# Altium project Camera-Controller-Board.PrjPcb (part 10 of 18)

## Sheet RK3588-GPIO.SchDoc
size 420 x 297 mm; SheetNumber: 13; SheetTotal: 22
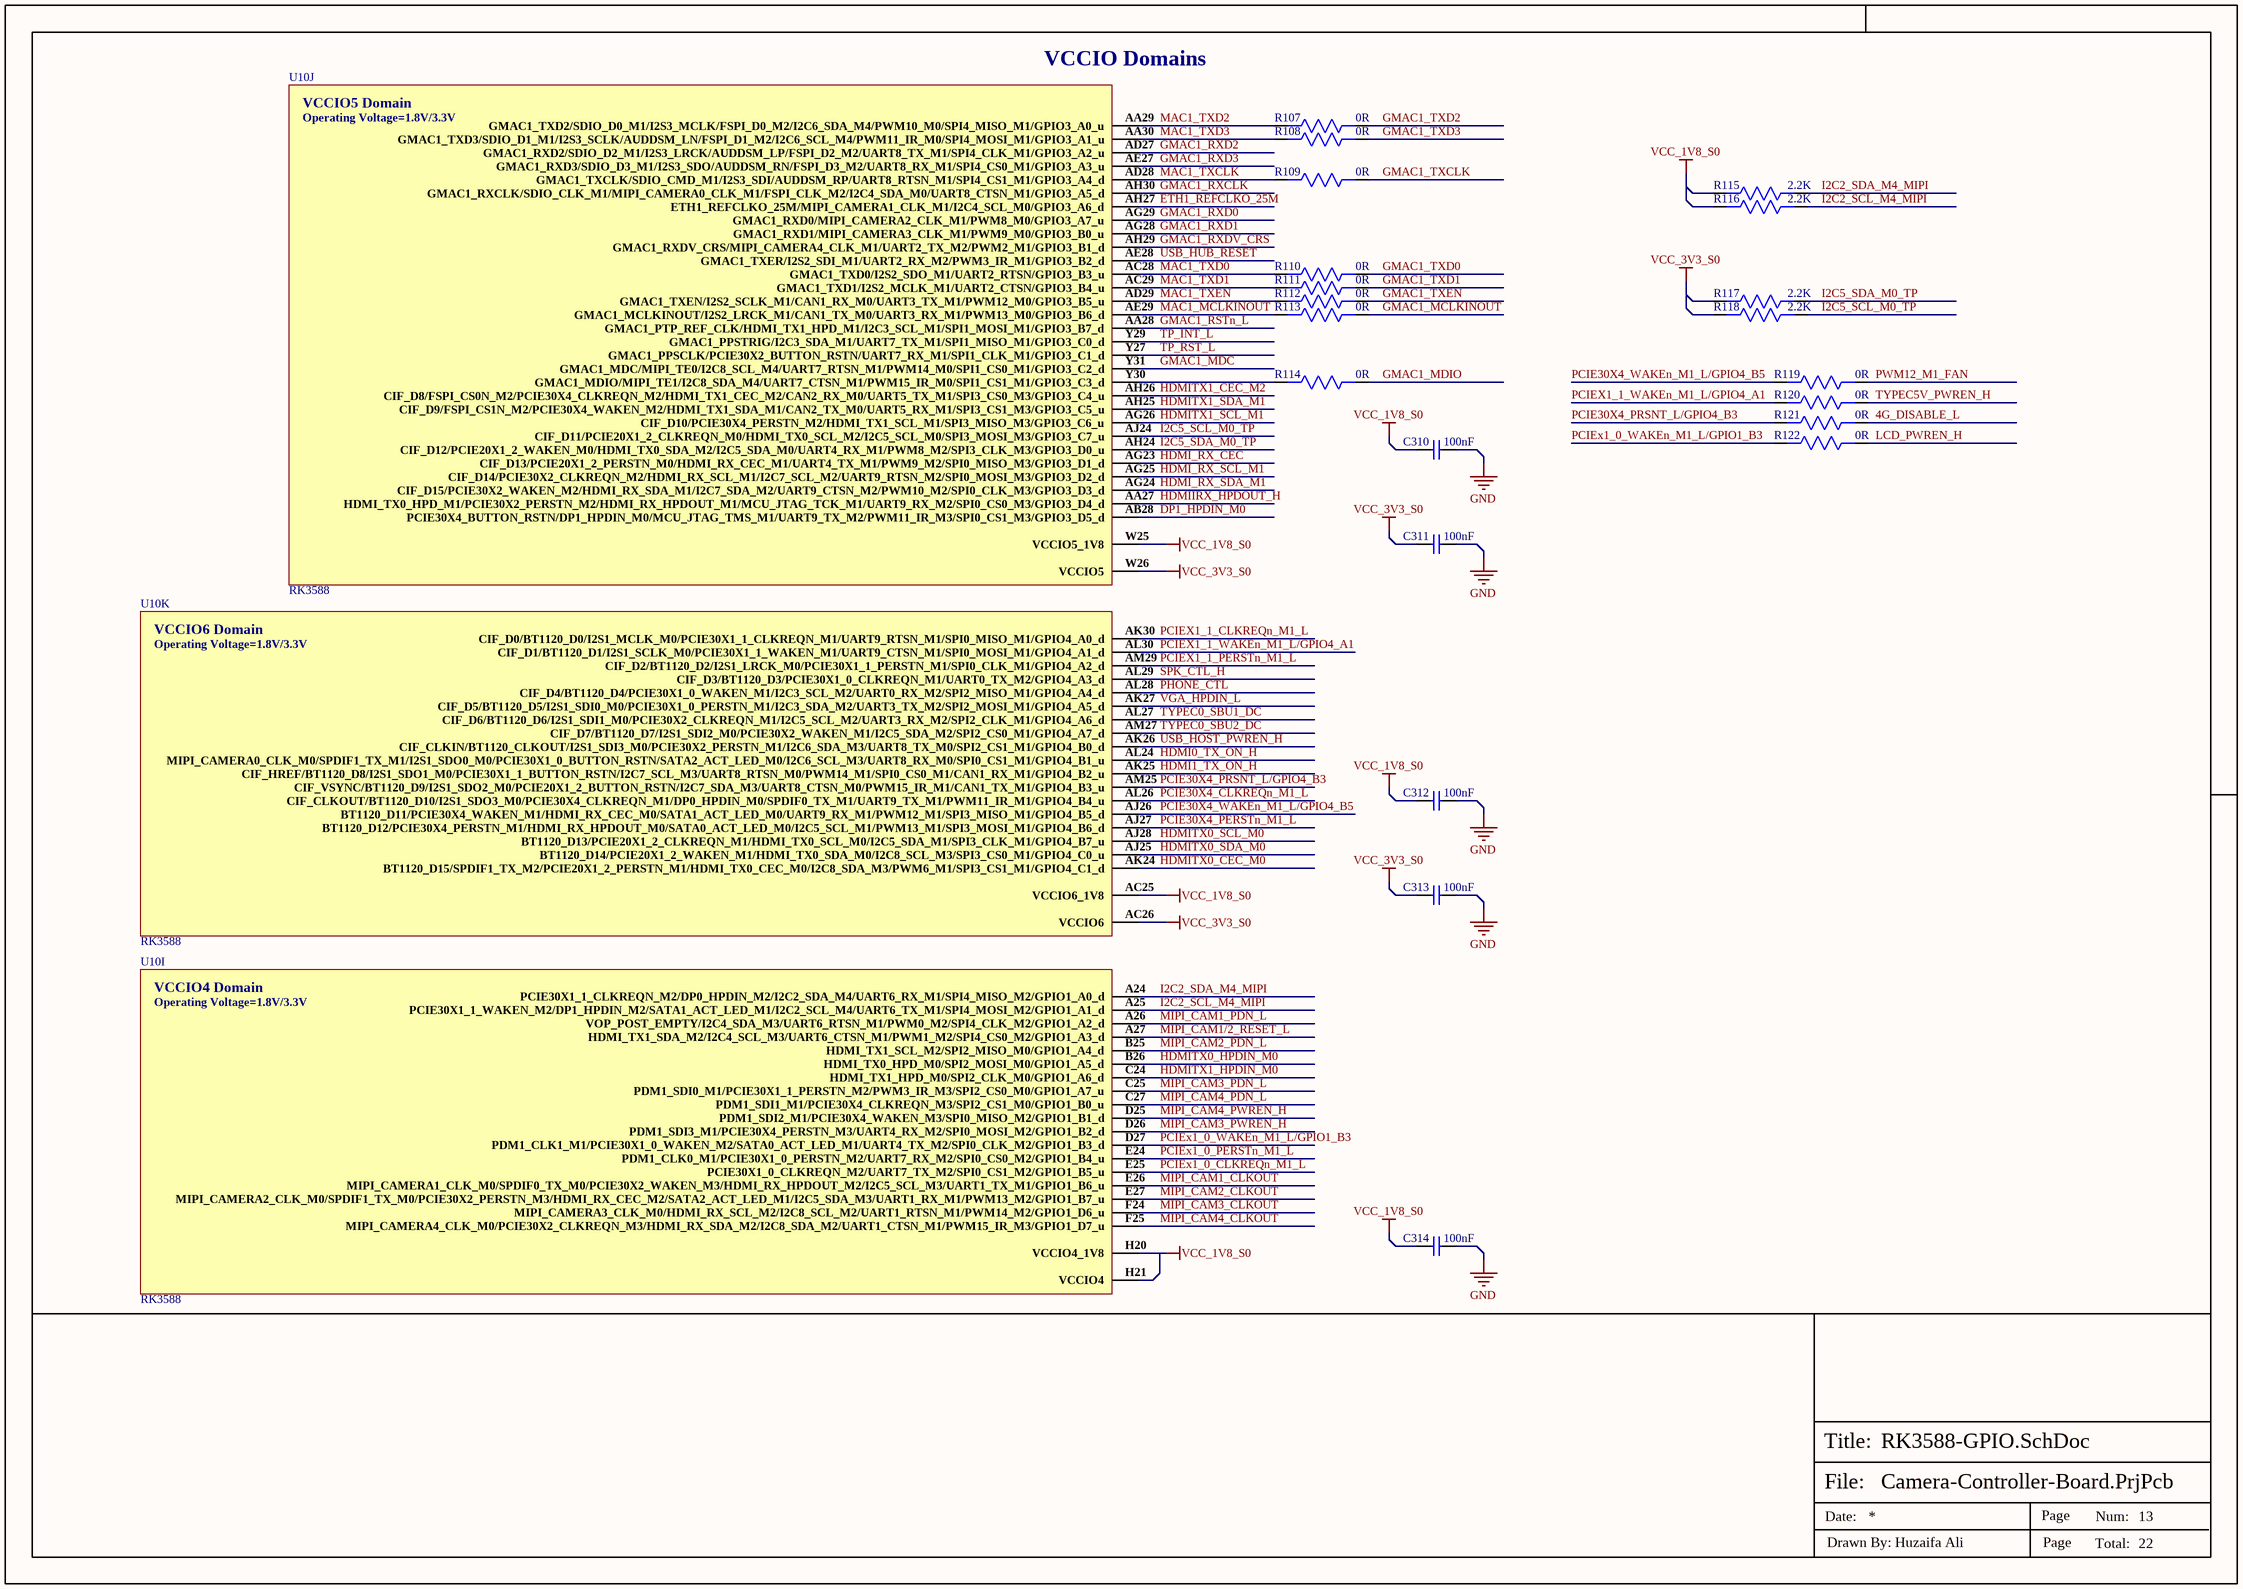
[diagram p12: RK3588-GPIO.SchDoc]

### Parts
C310  100nF  [CAP-0201]
C311  100nF  [CAP-0201]
C312  100nF  [CAP-0201]
C313  100nF  [CAP-0201]
C314  100nF  [CAP-0201]
R107  0R  [Res-0402]
R108  0R  [Res-0402]
R109  0R  [Res-0402]
R110  0R  [Res-0402]
R111  0R  [Res-0402]
R112  0R  [Res-0402]
R113  0R  [Res-0402]
R114  0R  [Res-0402]
R115  2.2K  [Res-0201]
R116  2.2K  [Res-0201]
R117  2.2K  [Res-0201]
R118  2.2K  [Res-0201]
R119  0R  [Res-0402]
R120  0R  [Res-0402]
R121  0R  [Res-0402]
R122  0R  [Res-0402]
U10  RK3588  [FCBGA-1088L]  (parts I,J,K of 26)

### Nets
GND: C310.2 C311.2 C312.2 C313.2 C314.2
VCC_1V8_S0: C310.1 C312.1 C314.1 R115.2 R116.2 U10.AC25(VCCIO6_1V8) U10.H20(VCCIO4_1V8) U10.H21(VCCIO4) U10.W25(VCCIO5_1V8)
VCC_3V3_S0: C311.1 C313.1 R117.2 R118.2 U10.AC26(VCCIO6) U10.W26(VCCIO5)
4G_DISABLE_L: R121.1
DP1_HPDIN_M0: U10.AB28(PCIE30X4_BUTTON_RSTN/DP1_HPDIN_M0/MCU_JTAG_TMS_M1/UART9_TX_M2/PWM11_IR_M3/SPI0_CS1_M3/GPIO3_D5_d)
ETH1_REFCLKO_25M: U10.AH27(ETH1_REFCLKO_25M/MIPI_CAMERA1_CLK_M1/I2C4_SCL_M0/GPIO3_A6_d)
GMAC1_MCLKINOUT: R113.1
GMAC1_MDC: U10.Y31(GMAC1_MDC/MIPI_TE0/I2C8_SCL_M4/UART7_RTSN_M1/PWM14_M0/SPI1_CS0_M1/GPIO3_C2_d)
GMAC1_MDIO: R114.1
GMAC1_RSTn_L: U10.AA28(GMAC1_PTP_REF_CLK/HDMI_TX1_HPD_M1/I2C3_SCL_M1/SPI1_MOSI_M1/GPIO3_B7_d)
GMAC1_RXCLK: U10.AH30(GMAC1_RXCLK/SDIO_CLK_M1/MIPI_CAMERA0_CLK_M1/FSPI_CLK_M2/I2C4_SDA_M0/UART8_CTSN_M1/GPIO3_A5_d)
GMAC1_RXD0: U10.AG29(GMAC1_RXD0/MIPI_CAMERA2_CLK_M1/PWM8_M0/GPIO3_A7_u)
GMAC1_RXD1: U10.AG28(GMAC1_RXD1/MIPI_CAMERA3_CLK_M1/PWM9_M0/GPIO3_B0_u)
GMAC1_RXD2: U10.AD27(GMAC1_RXD2/SDIO_D2_M1/I2S3_LRCK/AUDDSM_LP/FSPI_D2_M2/UART8_TX_M1/SPI4_CLK_M1/GPIO3_A2_u)
GMAC1_RXD3: U10.AE27(GMAC1_RXD3/SDIO_D3_M1/I2S3_SDO/AUDDSM_RN/FSPI_D3_M2/UART8_RX_M1/SPI4_CS0_M1/GPIO3_A3_u)
GMAC1_RXDV_CRS: U10.AH29(GMAC1_RXDV_CRS/MIPI_CAMERA4_CLK_M1/UART2_TX_M2/PWM2_M1/GPIO3_B1_d)
GMAC1_TXCLK: R109.1
GMAC1_TXD0: R110.1
GMAC1_TXD1: R111.1
GMAC1_TXD2: R107.1
GMAC1_TXD3: R108.1
GMAC1_TXEN: R112.1
HDMI0_TX_ON_H: U10.AL24(MIPI_CAMERA0_CLK_M0/SPDIF1_TX_M1/I2S1_SDO0_M0/PCIE30X1_0_BUTTON_RSTN/SATA2_ACT_LED_M0/I2C6_SCL_M3/UART8_RX_M0/SPI0_CS1_M1/GPIO4_B1_u)
HDMI1_TX_ON_H: U10.AK25(CIF_HREF/BT1120_D8/I2S1_SDO1_M0/PCIE30X1_1_BUTTON_RSTN/I2C7_SCL_M3/UART8_RTSN_M0/PWM14_M1/SPI0_CS0_M1/CAN1_RX_M1/GPIO4_B2_u)
HDMI_RX_CEC: U10.AG23(CIF_D13/PCIE20X1_2_PERSTN_M0/HDMI_RX_CEC_M1/UART4_TX_M1/PWM9_M2/SPI0_MISO_M3/GPIO3_D1_d)
HDMI_RX_SCL_M1: U10.AG25(CIF_D14/PCIE30X2_CLKREQN_M2/HDMI_RX_SCL_M1/I2C7_SCL_M2/UART9_RTSN_M2/SPI0_MOSI_M3/GPIO3_D2_d)
HDMI_RX_SDA_M1: U10.AG24(CIF_D15/PCIE30X2_WAKEN_M2/HDMI_RX_SDA_M1/I2C7_SDA_M2/UART9_CTSN_M2/PWM10_M2/SPI0_CLK_M3/GPIO3_D3_d)
HDMIIRX_HPDOUT_H: U10.AA27(HDMI_TX0_HPD_M1/PCIE30X2_PERSTN_M2/HDMI_RX_HPDOUT_M1/MCU_JTAG_TCK_M1/UART9_RX_M2/SPI0_CS0_M3/GPIO3_D4_d)
HDMITX0_CEC_M0: U10.AK24(BT1120_D15/SPDIF1_TX_M2/PCIE20X1_2_PERSTN_M1/HDMI_TX0_CEC_M0/I2C8_SDA_M3/PWM6_M1/SPI3_CS1_M1/GPIO4_C1_d)
HDMITX0_HPDIN_M0: U10.B26(HDMI_TX0_HPD_M0/SPI2_MOSI_M0/GPIO1_A5_d)
HDMITX0_SCL_M0: U10.AJ28(BT1120_D13/PCIE20X1_2_CLKREQN_M1/HDMI_TX0_SCL_M0/I2C5_SDA_M1/SPI3_CLK_M1/GPIO4_B7_u)
HDMITX0_SDA_M0: U10.AJ25(BT1120_D14/PCIE20X1_2_WAKEN_M1/HDMI_TX0_SDA_M0/I2C8_SCL_M3/SPI3_CS0_M1/GPIO4_C0_u)
HDMITX1_CEC_M2: U10.AH26(CIF_D8/FSPI_CS0N_M2/PCIE30X4_CLKREQN_M2/HDMI_TX1_CEC_M2/CAN2_RX_M0/UART5_TX_M1/SPI3_CS0_M3/GPIO3_C4_u)
HDMITX1_HPDIN_M0: U10.C24(HDMI_TX1_HPD_M0/SPI2_CLK_M0/GPIO1_A6_d)
HDMITX1_SCL_M1: U10.AG26(CIF_D10/PCIE30X4_PERSTN_M2/HDMI_TX1_SCL_M1/SPI3_MISO_M3/GPIO3_C6_u)
HDMITX1_SDA_M1: U10.AH25(CIF_D9/FSPI_CS1N_M2/PCIE30X4_WAKEN_M2/HDMI_TX1_SDA_M1/CAN2_TX_M0/UART5_RX_M1/SPI3_CS1_M3/GPIO3_C5_u)
I2C2_SCL_M4_MIPI: R116.1 U10.A25(PCIE30X1_1_WAKEN_M2/DP1_HPDIN_M2/SATA1_ACT_LED_M1/I2C2_SCL_M4/UART6_TX_M1/SPI4_MOSI_M2/GPIO1_A1_d)
I2C2_SDA_M4_MIPI: R115.1 U10.A24(PCIE30X1_1_CLKREQN_M2/DP0_HPDIN_M2/I2C2_SDA_M4/UART6_RX_M1/SPI4_MISO_M2/GPIO1_A0_d)
I2C5_SCL_M0_TP: R118.1 U10.AJ24(CIF_D11/PCIE20X1_2_CLKREQN_M0/HDMI_TX0_SCL_M2/I2C5_SCL_M0/SPI3_MOSI_M3/GPIO3_C7_u)
I2C5_SDA_M0_TP: R117.1 U10.AH24(CIF_D12/PCIE20X1_2_WAKEN_M0/HDMI_TX0_SDA_M2/I2C5_SDA_M0/UART4_RX_M1/PWM8_M2/SPI3_CLK_M3/GPIO3_D0_u)
LCD_PWREN_H: R122.1
MAC1_MCLKINOUT: R113.2 U10.AE29(GMAC1_MCLKINOUT/I2S2_LRCK_M1/CAN1_TX_M0/UART3_RX_M1/PWM13_M0/GPIO3_B6_d)
MAC1_TXCLK: R109.2 U10.AD28(GMAC1_TXCLK/SDIO_CMD_M1/I2S3_SDI/AUDDSM_RP/UART8_RTSN_M1/SPI4_CS1_M1/GPIO3_A4_d)
MAC1_TXD0: R110.2 U10.AC28(GMAC1_TXD0/I2S2_SDO_M1/UART2_RTSN/GPIO3_B3_u)
MAC1_TXD1: R111.2 U10.AC29(GMAC1_TXD1/I2S2_MCLK_M1/UART2_CTSN/GPIO3_B4_u)
MAC1_TXD2: R107.2 U10.AA29(GMAC1_TXD2/SDIO_D0_M1/I2S3_MCLK/FSPI_D0_M2/I2C6_SDA_M4/PWM10_M0/SPI4_MISO_M1/GPIO3_A0_u)
MAC1_TXD3: R108.2 U10.AA30(GMAC1_TXD3/SDIO_D1_M1/I2S3_SCLK/AUDDSM_LN/FSPI_D1_M2/I2C6_SCL_M4/PWM11_IR_M0/SPI4_MOSI_M1/GPIO3_A1_u)
MAC1_TXEN: R112.2 U10.AD29(GMAC1_TXEN/I2S2_SCLK_M1/CAN1_RX_M0/UART3_TX_M1/PWM12_M0/GPIO3_B5_u)
MIPI_CAM1/2_RESET_L: U10.A27(HDMI_TX1_SDA_M2/I2C4_SCL_M3/UART6_CTSN_M1/PWM1_M2/SPI4_CS0_M2/GPIO1_A3_d)
MIPI_CAM1_CLKOUT: U10.E26(MIPI_CAMERA1_CLK_M0/SPDIF0_TX_M0/PCIE30X2_WAKEN_M3/HDMI_RX_HPDOUT_M2/I2C5_SCL_M3/UART1_TX_M1/GPIO1_B6_u)
MIPI_CAM1_PDN_L: U10.A26(VOP_POST_EMPTY/I2C4_SDA_M3/UART6_RTSN_M1/PWM0_M2/SPI4_CLK_M2/GPIO1_A2_d)
MIPI_CAM2_CLKOUT: U10.E27(MIPI_CAMERA2_CLK_M0/SPDIF1_TX_M0/PCIE30X2_PERSTN_M3/HDMI_RX_CEC_M2/SATA2_ACT_LED_M1/I2C5_SDA_M3/UART1_RX_M1/PWM13_M2/GPIO1_B7_u)
MIPI_CAM2_PDN_L: U10.B25(HDMI_TX1_SCL_M2/SPI2_MISO_M0/GPIO1_A4_d)
MIPI_CAM3_CLKOUT: U10.F24(MIPI_CAMERA3_CLK_M0/HDMI_RX_SCL_M2/I2C8_SCL_M2/UART1_RTSN_M1/PWM14_M2/GPIO1_D6_u)
MIPI_CAM3_PDN_L: U10.C25(PDM1_SDI0_M1/PCIE30X1_1_PERSTN_M2/PWM3_IR_M3/SPI2_CS0_M0/GPIO1_A7_u)
MIPI_CAM3_PWREN_H: U10.D26(PDM1_SDI3_M1/PCIE30X4_PERSTN_M3/UART4_RX_M2/SPI0_MOSI_M2/GPIO1_B2_d)
MIPI_CAM4_CLKOUT: U10.F25(MIPI_CAMERA4_CLK_M0/PCIE30X2_CLKREQN_M3/HDMI_RX_SDA_M2/I2C8_SDA_M2/UART1_CTSN_M1/PWM15_IR_M3/GPIO1_D7_u)
MIPI_CAM4_PDN_L: U10.C27(PDM1_SDI1_M1/PCIE30X4_CLKREQN_M3/SPI2_CS1_M0/GPIO1_B0_u)
MIPI_CAM4_PWREN_H: U10.D25(PDM1_SDI2_M1/PCIE30X4_WAKEN_M3/SPI0_MISO_M2/GPIO1_B1_d)
PCIE30X4_CLKREQn_M1_L: U10.AL26(CIF_CLKOUT/BT1120_D10/I2S1_SDO3_M0/PCIE30X4_CLKREQN_M1/DP0_HPDIN_M0/SPDIF0_TX_M1/UART9_TX_M1/PWM11_IR_M1/GPIO4_B4_u)
PCIE30X4_PERSTn_M1_L: U10.AJ27(BT1120_D12/PCIE30X4_PERSTN_M1/HDMI_RX_HPDOUT_M0/SATA0_ACT_LED_M0/I2C5_SCL_M1/PWM13_M1/SPI3_MOSI_M1/GPIO4_B6_d)
PCIE30X4_PRSNT_L/GPIO4_B3: R121.2 U10.AM25(CIF_VSYNC/BT1120_D9/I2S1_SDO2_M0/PCIE20X1_2_BUTTON_RSTN/I2C7_SDA_M3/UART8_CTSN_M0/PWM15_IR_M1/CAN1_TX_M1/GPIO4_B3_u)
PCIE30X4_WAKEn_M1_L/GPIO4_B5: R119.2 U10.AJ26(BT1120_D11/PCIE30X4_WAKEN_M1/HDMI_RX_CEC_M0/SATA1_ACT_LED_M0/UART9_RX_M1/PWM12_M1/SPI3_MISO_M1/GPIO4_B5_d)
PCIEx1_0_CLKREQn_M1_L: U10.E25(PCIE30X1_0_CLKREQN_M2/UART7_TX_M2/SPI0_CS1_M2/GPIO1_B5_u)
PCIEx1_0_PERSTn_M1_L: U10.E24(PDM1_CLK0_M1/PCIE30X1_0_PERSTN_M2/UART7_RX_M2/SPI0_CS0_M2/GPIO1_B4_u)
PCIEx1_0_WAKEn_M1_L/GPIO1_B3: R122.2 U10.D27(PDM1_CLK1_M1/PCIE30X1_0_WAKEN_M2/SATA0_ACT_LED_M1/UART4_TX_M2/SPI0_CLK_M2/GPIO1_B3_d)
PCIEX1_1_CLKREQn_M1_L: U10.AK30(CIF_D0/BT1120_D0/I2S1_MCLK_M0/PCIE30X1_1_CLKREQN_M1/UART9_RTSN_M1/SPI0_MISO_M1/GPIO4_A0_d)
PCIEX1_1_PERSTn_M1_L: U10.AM29(CIF_D2/BT1120_D2/I2S1_LRCK_M0/PCIE30X1_1_PERSTN_M1/SPI0_CLK_M1/GPIO4_A2_d)
PCIEX1_1_WAKEn_M1_L/GPIO4_A1: R120.2 U10.AL30(CIF_D1/BT1120_D1/I2S1_SCLK_M0/PCIE30X1_1_WAKEN_M1/UART9_CTSN_M1/SPI0_MOSI_M1/GPIO4_A1_d)
PHONE_CTL: U10.AL28(CIF_D4/BT1120_D4/PCIE30X1_0_WAKEN_M1/I2C3_SCL_M2/UART0_RX_M2/SPI2_MISO_M1/GPIO4_A4_d)
PWM12_M1_FAN: R119.1
SPK_CTL_H: U10.AL29(CIF_D3/BT1120_D3/PCIE30X1_0_CLKREQN_M1/UART0_TX_M2/GPIO4_A3_d)
TP_INT_L: U10.Y29(GMAC1_PPSTRIG/I2C3_SDA_M1/UART7_TX_M1/SPI1_MISO_M1/GPIO3_C0_d)
TP_RST_L: U10.Y27(GMAC1_PPSCLK/PCIE30X2_BUTTON_RSTN/UART7_RX_M1/SPI1_CLK_M1/GPIO3_C1_d)
TYPEC0_SBU1_DC: U10.AL27(CIF_D6/BT1120_D6/I2S1_SDI1_M0/PCIE30X2_CLKREQN_M1/I2C5_SCL_M2/UART3_RX_M2/SPI2_CLK_M1/GPIO4_A6_d)
TYPEC0_SBU2_DC: U10.AM27(CIF_D7/BT1120_D7/I2S1_SDI2_M0/PCIE30X2_WAKEN_M1/I2C5_SDA_M2/SPI2_CS0_M1/GPIO4_A7_d)
TYPEC5V_PWREN_H: R120.1
USB_HOST_PWREN_H: U10.AK26(CIF_CLKIN/BT1120_CLKOUT/I2S1_SDI3_M0/PCIE30X2_PERSTN_M1/I2C6_SDA_M3/UART8_TX_M0/SPI2_CS1_M1/GPIO4_B0_d)
USB_HUB_RESET: U10.AE28(GMAC1_TXER/I2S2_SDI_M1/UART2_RX_M2/PWM3_IR_M1/GPIO3_B2_d)
VGA_HPDIN_L: U10.AK27(CIF_D5/BT1120_D5/I2S1_SDI0_M0/PCIE30X1_0_PERSTN_M1/I2C3_SDA_M2/UART3_TX_M2/SPI2_MOSI_M1/GPIO4_A5_d)
NetR114_2: R114.2 U10.Y30(GMAC1_MDIO/MIPI_TE1/I2C8_SDA_M4/UART7_CTSN_M1/PWM15_IR_M0/SPI1_CS1_M1/GPIO3_C3_d)

### Notes on the sheet
- VCCIO Domains
- File:
- Title:
- Date:
- Page
- Num:
- Total:
- Drawn By: Huzaifa Ali
- (in symbol RK3588, part I) VCCIO4 Domain; Operating Voltage=1.8V/3.3V
- (in symbol RK3588, part J) VCCIO5 Domain; Operating Voltage=1.8V/3.3V
- (in symbol RK3588, part K) VCCIO6 Domain; Operating Voltage=1.8V/3.3V

### Library data of the parts
C310-C314 = CC0201KRX5R5BB104: as C244 on sheet RK3588-OSC-PLL-PMUIO; Supplier 1: Digi-Key; Manufacturer Part Number: CC0201KRX5R5BB104; RoHS: Yes; Category: Ceramic Capacitors; Stock 1: 3711589; Pricing 1: 1=0.10000, 10=0.02100, 50=0.01160, 100=0.00960, 500=0.00682, 1000=0.00536, 2500=0.00487, 5000=0.00448 (USD); Mount: Surface Mount; Case/Package: 0201; Number of Pins: 2; Case Code (Imperial): 0201; Case Code (Metric): 0603; Min Operating Temperature: -55°C; Max Operating Temperature: 85°C; Capacitance: 100nF; Dielectric: X5R; Voltage Rating: 6.3V; Packaging: Tape and Reel; Package Quantity: 1; Voltage Rating (DC): 6.3V; Termination: SMD/SMT; Resistor Type: Ceramic; Series: CC; Length: 0.6mm; Width: 0.012inch; Height: 0.3mm; Thickness: 0.013inch; Depth: 0.3mm; Reach SVHC Compliant: Yes; Lead Free: Lead Free; Halogen Free: Halogen Free; RoHS Compliant: Yes; ComponentLink1URL: https://datasheet.ciiva.com/7656/1525783-7656597.pdf?src-supplier=Element14; ComponentLink1Description: https://datasheet.ciiva.com/7656/1525783-7656597.pdf?src-supplier=Element14; ComponentLink2URL: https://datasheet.ciiva.com/28450/1359354-28450200.pdf?src-supplier=Element14; ComponentLink2Description: https://datasheet.ciiva.com/28450/1359354-28450200.pdf?src-supplier=Element14; ComponentLink3URL: https://datasheet.ciiva.com/176/mlccorderingcode-176766.pdf?src-supplier=Digi-Key; ComponentLink3Description: https://datasheet.ciiva.com/176/mlccorderingcode-176766.pdf?src-supplier=Digi-Key; ComponentLink4URL: https://datasheet.ciiva.com/176/mlccorderingcode-176765.pdf?src-supplier=Digi-Key; ComponentLink4Description: https://datasheet.ciiva.com/176/mlccorderingcode-176765.pdf?src-supplier=Digi-Key; ComponentLink5URL: https://datasheet.ciiva.com/176/mlccorderingcode-176767.pdf?src-supplier=Digi-Key; ComponentLink5Description: https://datasheet.ciiva.com/176/mlccorderingcode-176767.pdf?src-supplier=Digi-Key; Supplier Part Number 1: 311-1408-1-ND
R107-R114 R119-R122 = RC0402FR-070RL: RES 0 OHM JUMPER 1/16W 0402; Manufacturer: Yageo; Tolerance: 1%; Power Rating: 62.5mW; Voltage Rating: 50V; Temperature Coefficient: 200ppm/°C; Max Power Dissipation: 63mW; Supplier 1: Mouser; Manufacturer Part Number: RC0402FR-070RL; RoHS: Yes; Category: Chip SMD Resistors; Stock 1: 8556842; Pricing 1: 1=0.10000, 10=0.01400, 50=0.01400, 100=0.00600, 1000=0.00300, 5000=0.00200, 10000=0.00100 (USD); Mount: Surface Mount; Case/Package: 0402; Contact Plating: Tin,Matte; Case Code (Imperial): 0402; Case Code (Metric): 1005; Size Code: 0402; Min Operating Temperature: -55°C; Max Operating Temperature: 155°C; Resistance: 0R; Resistor Type: Thick Film; Packaging: Tape and Reel; Termination: SMD/SMT; Features: Moisture Resistant; Series: RC; Number of Terminations: 2; Length: 1mm; Width: 0.5mm; Height: 0.35mm; Radiation Hardening: No; Lead Free: Lead Free; RoHS Compliant: Yes; ComponentLink1URL: https://datasheet.ciiva.com/8896/pyu-rc0402-51-rohs-l-6-8896149.pdf?src-supplier=Avnet; ComponentLink1Description: https://datasheet.ciiva.com/8896/pyu-rc0402-51-rohs-l-6-8896149.pdf?src-supplier=Avnet; ComponentLink2URL: https://datasheet.ciiva.com/16790/pyu-rc0402-51-rohs-l-6-r-16790444.pdf?src-supplier=Future+Electronics; ComponentLink2Description: https://datasheet.ciiva.com/16790/pyu-rc0402-51-rohs-l-6-r-16790444.pdf?src-supplier=Future+Electronics; Supplier Part Number 1: 603-RC0402FR-070RL; LCSC Part Number: C106231
R115-R118 = RC0201FR-072K2L: as R69 on sheet RK3588-OSC-PLL-PMUIO; Supplier 1: Digi-Key; Manufacturer Part Number: RC0201FR-072K2L; RoHS: Yes; Category: Chip SMD Resistors; Stock 1: 1171924; Pricing 1: 1=0.10000, 10=0.03700, 100=0.01500, 1000=0.00672, 2500=0.00583, 5000=0.00482 (USD); Case/Package: 0201; Case Code (Imperial): 0201; Case Code (Metric): 0603; Size Code: 0201; Min Operating Temperature: -55°C; Max Operating Temperature: 125°C; Tolerance: 1%; Packaging: Tape and Reel; Resistor Type: Thick Film; Number of Terminations: 2; Termination: SMD/SMT; Max Power Dissipation: 50mW; Features: Moisture Resistant; Series: RC; Resistance Tolerance: 1%; Construction: Rectangular; Length: 0.024inch; Width: 0.3mm; Height: 0.01inch; Depth: 0.3mm; Military Standard: Not; Lead Free: Lead Free; RoHS Compliant: Yes; ComponentLink1URL: https://datasheet.ciiva.com/7672/1563626-7672218.pdf?src-supplier=Element14; ComponentLink1Description: https://datasheet.ciiva.com/7672/1563626-7672218.pdf?src-supplier=Element14; Supplier Part Number 1: YAG2572CT-ND
U10 = RK3588: as U10 on sheet RK3588-OSC-PLL-PMUIO; LCSC Part Number: *; Item Type: IC